# Altium project GTV11-Board.PrjPcb (part 1 of 4)
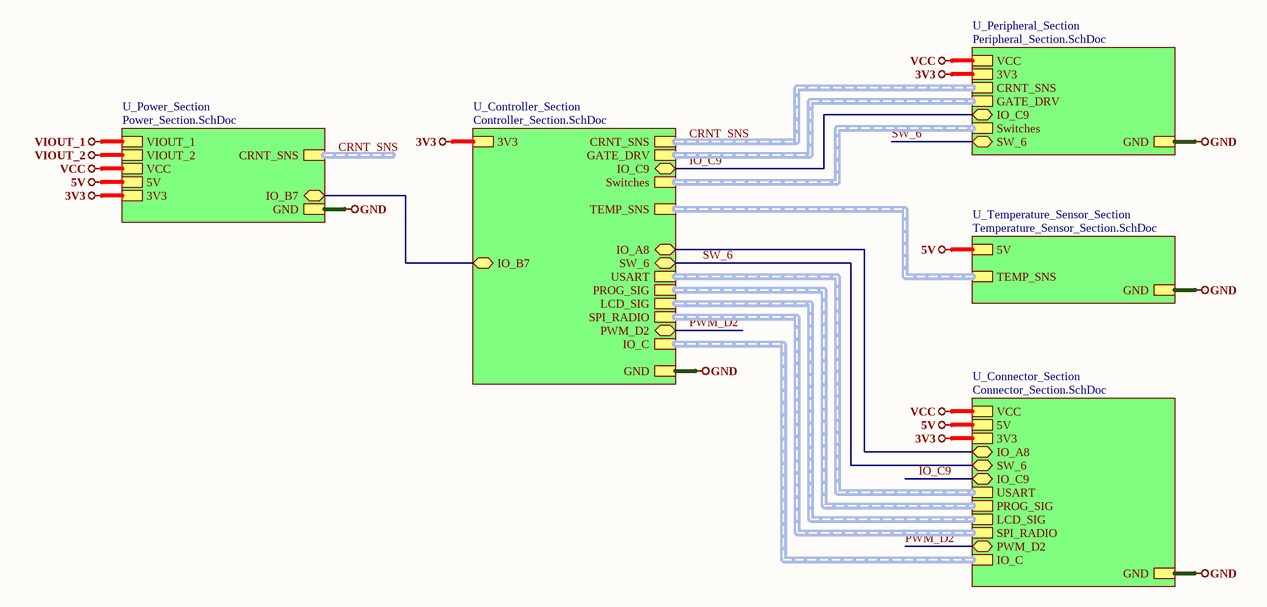
[diagram p0: Top_Sheet.SchDoc]
12 sheets, 168 parts. Net scope: hierarchical (ports join the sheet entries above them; power ports are global).
Sheets:
  Top_Sheet.SchDoc
    U_Power_Section = Power_Section.SchDoc
      U_Regulator_Sheet = Regulator_Sheet.SchDoc
      U_Current_Sense_Sheet = Current_Sense_Sheet.SchDoc
      U_Battery_Charger_Sheet = Battery_Charger_Sheet.SchDoc
    U_Controller_Section = Controller_Section.SchDoc
    U_Connector_Section = Connector_Section.SchDoc
    U_Peripheral_Section = Peripheral_Section.SchDoc
      U_Switches_Sheet = Switches_Sheet.SchDoc
      U_Gate_Driver_Sheet = Gate_Driver_Sheet.SchDoc
      U_Heater_Sheet = Heater_Sheet.SchDoc
    U_Temperature_Sensor_Section = Temperature_Sensor_Section.SchDoc

## Sheet Top_Sheet.SchDoc
size A4

### Sub-sheets
U_Connector_Section = Connector_Section.SchDoc: LCD_SIG (harness LCD_SIG), PROG_SIG (harness PROG_SIG), USART (harness DEBUG), IO_A8 (bidir), SW_6 (bidir), VCC, 5V, 3V3, GND, SPI_RADIO (harness SPI_RADIO), PWM_D2 (bidir), IO_C (harness SPI_RADIO), IO_C9 (bidir)
U_Controller_Section = Controller_Section.SchDoc: Switches (harness Switches), LCD_SIG (harness LCD_SIG), PROG_SIG (harness PROG_SIG), USART (harness DEBUG), IO_A8 (bidir), CRNT_SNS (harness CRNT_SNS), TEMP_SNS (harness TEMP_SNS), SW_6 (bidir), GATE_DRV (harness GATE_DRV), IO_C9 (bidir), GND, 3V3, IO_B7 (bidir), SPI_RADIO (harness SPI_RADIO), PWM_D2 (bidir), IO_C (harness SPI_RADIO)
U_Peripheral_Section = Peripheral_Section.SchDoc: VCC, GND, 3V3, GATE_DRV (harness GATE_DRV), IO_C9 (bidir), Switches (harness Switches), SW_6 (bidir), CRNT_SNS (harness CRNT_SNS)
U_Power_Section = Power_Section.SchDoc: VIOUT_1, VIOUT_2, VCC, 5V, 3V3, GND, CRNT_SNS (harness CRNT_SNS), IO_B7 (bidir)
U_Temperature_Sensor_Section = Temperature_Sensor_Section.SchDoc: TEMP_SNS (harness TEMP_SNS), 5V, GND

### Nets
3V3: sheet U_Power_Section/3V3, sheet U_Controller_Section/3V3, sheet U_Connector_Section/3V3, sheet U_Peripheral_Section/3V3
5V: sheet U_Power_Section/5V, sheet U_Connector_Section/5V, sheet U_Temperature_Sensor_Section/5V
GND: sheet U_Power_Section/GND, sheet U_Controller_Section/GND, sheet U_Connector_Section/GND, sheet U_Peripheral_Section/GND, sheet U_Temperature_Sensor_Section/GND
VCC: sheet U_Power_Section/VCC, sheet U_Connector_Section/VCC, sheet U_Peripheral_Section/VCC
IO_A8: sheet U_Controller_Section/IO_A8, sheet U_Connector_Section/IO_A8
IO_B7: sheet U_Power_Section/IO_B7, sheet U_Controller_Section/IO_B7
IO_C9: sheet U_Controller_Section/IO_C9, sheet U_Connector_Section/IO_C9, sheet U_Peripheral_Section/IO_C9
PWM_D2: sheet U_Controller_Section/PWM_D2, sheet U_Connector_Section/PWM_D2
SW_6: sheet U_Controller_Section/SW_6, sheet U_Connector_Section/SW_6, sheet U_Peripheral_Section/SW_6

### Buses and harness runs
harness CRNT_SNS = sheet U_Controller_Section/CRNT_SNS = sheet U_Peripheral_Section/CRNT_SNS
harness CRNT_SNS = sheet U_Power_Section/CRNT_SNS
harness sheet U_Connector_Section/IO_C = sheet U_Controller_Section/IO_C
harness sheet U_Connector_Section/LCD_SIG = sheet U_Controller_Section/LCD_SIG
harness sheet U_Connector_Section/PROG_SIG = sheet U_Controller_Section/PROG_SIG
harness sheet U_Connector_Section/SPI_RADIO = sheet U_Controller_Section/SPI_RADIO
harness sheet U_Connector_Section/USART = sheet U_Controller_Section/USART
harness sheet U_Controller_Section/GATE_DRV = sheet U_Peripheral_Section/GATE_DRV
harness sheet U_Controller_Section/Switches = sheet U_Peripheral_Section/Switches
harness sheet U_Controller_Section/TEMP_SNS = sheet U_Temperature_Sensor_Section/TEMP_SNS

## Sheet Power_Section.SchDoc
size A4
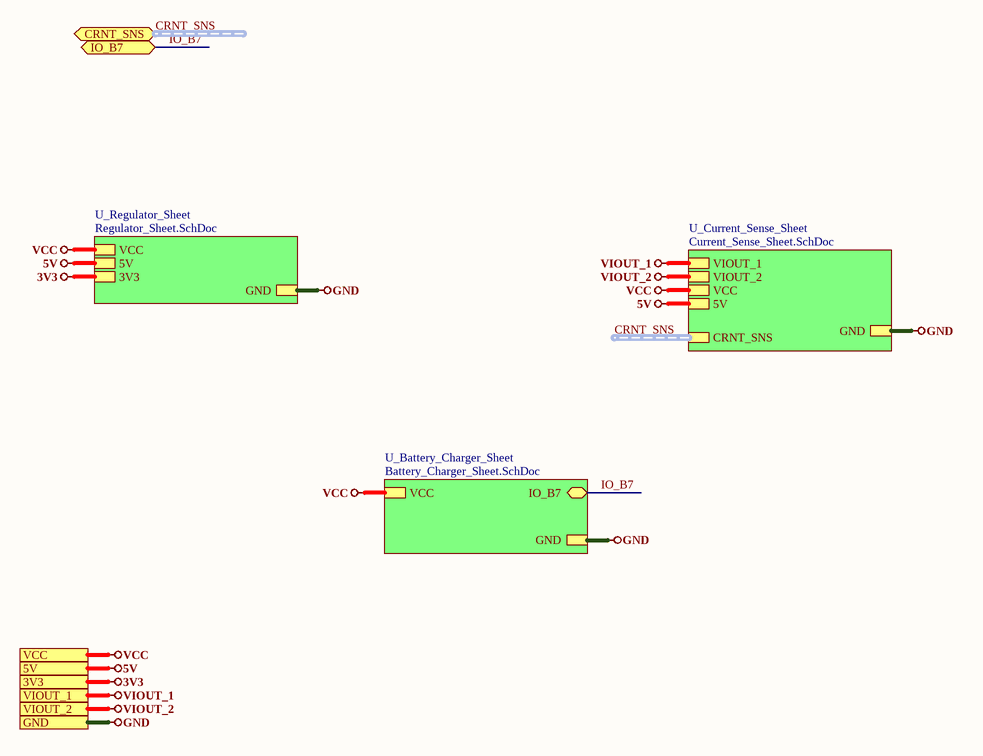
[diagram p1: Power_Section.SchDoc]

### Sub-sheets
U_Battery_Charger_Sheet = Battery_Charger_Sheet.SchDoc: VCC, GND, IO_B7 (bidir)
U_Current_Sense_Sheet = Current_Sense_Sheet.SchDoc: CRNT_SNS (harness CRNT_SNS), VIOUT_1, VCC, 5V, VIOUT_2, GND
U_Regulator_Sheet = Regulator_Sheet.SchDoc: VCC, 5V, 3V3, GND

### Ports
3V3, 5V, CRNT_SNS (bidir, harness CRNT_SNS), GND, IO_B7 (bidir), VCC, VIOUT_1, VIOUT_2

### Nets
3V3: port 3V3, sheet U_Regulator_Sheet/3V3
5V: port 5V, sheet U_Regulator_Sheet/5V, sheet U_Current_Sense_Sheet/5V
GND: port GND, sheet U_Regulator_Sheet/GND, sheet U_Current_Sense_Sheet/GND, sheet U_Battery_Charger_Sheet/GND
VCC: port VCC, sheet U_Regulator_Sheet/VCC, sheet U_Current_Sense_Sheet/VCC, sheet U_Battery_Charger_Sheet/VCC
VIOUT_1: port VIOUT_1, sheet U_Current_Sense_Sheet/VIOUT_1
VIOUT_2: port VIOUT_2, sheet U_Current_Sense_Sheet/VIOUT_2
IO_B7: port IO_B7, sheet U_Battery_Charger_Sheet/IO_B7

### Buses and harness runs
harness CRNT_SNS = port CRNT_SNS
harness CRNT_SNS = sheet U_Current_Sense_Sheet/CRNT_SNS

## Sheet Regulator_Sheet.SchDoc
size A4
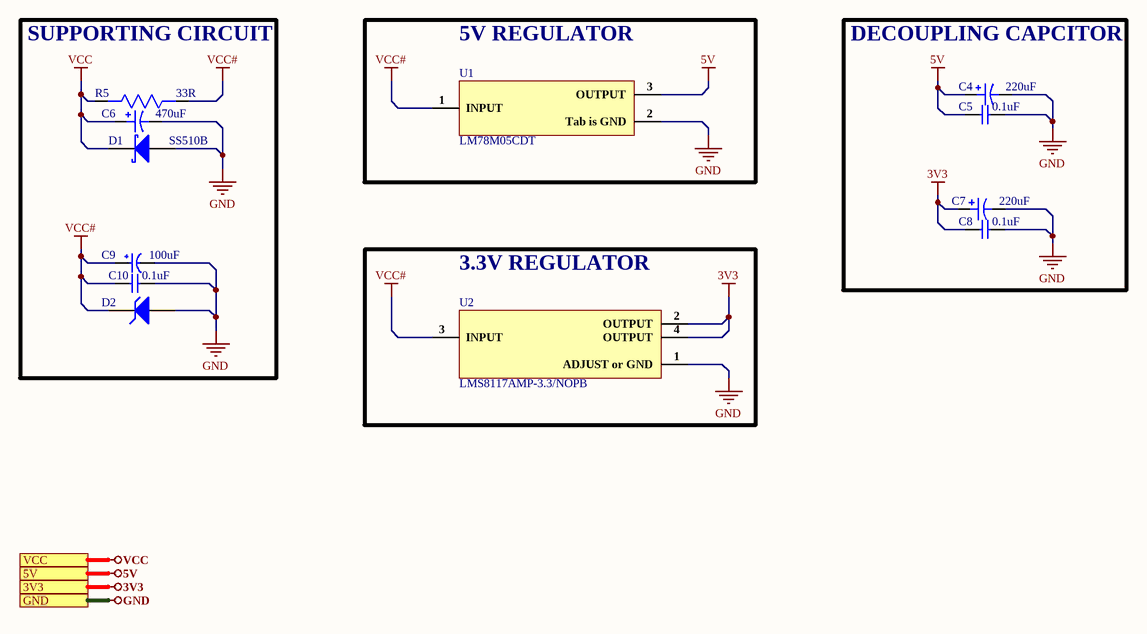
[diagram p2: Regulator_Sheet.SchDoc]

### Parts
C4  220uF  [UCD1H221MNL1GS]
C5  0.1uF  [Cap0603]
C6  470uF  [VT1H471MI135000CE0]
C7  220uF  [UCD1H221MNL1GS]
C8  0.1uF  [Cap0603]
C9  100uF  [UWX1E101MCL1GB]
C10  0.1uF  [Cap0603]
D1  SS510B  [SS510B]
D2  1SMA5930BT3G  [SMA]  (value not drawn)
R5  33R  [RES-0603]
U1  LM78M05CDT  [TO-252-3]
U2  LMS8117AMP-3.3/NOPB  [SOT-223]

### Blocks framed on the sheet
SUPPORTING CIRCUIT: C6 C9 C10 D1 D2 R5
5V REGULATOR: U1
DECOUPLING CAPCITOR: C4 C5 C7 C8
3.3V REGULATOR: U2

### Ports
3V3, 5V, GND, VCC

### Nets
3V3: C7.1 C8.1 U2.2(OUTPUT) U2.4(OUTPUT) ; port 3V3
5V: C4.1 C5.1 U1.3(OUTPUT) ; port 5V
GND: C4.2 C5.2 C6.2 C7.2 C8.2 C9.2 C10.2 D1.2(A) D2.2(A) U1.2(Tab_is_GND) U2.1(ADJUST_or_GND) ; port GND
VCC: C6.1 D1.1(K) R5.2 ; port VCC
VCC#: C9.1 C10.1 D2.1(K) R5.1 U1.1(INPUT) U2.3(INPUT)

### Library data of the parts
C4 C7 = UCD1H221MNL1GS: CAP ALUM 220UF 20% 50V SMD; Manufacturer: Nichicon; Ripple Current: 700mA; Impedance: 160mR; Leakage Current: 3uA; Life (Hours): 5000Hour; Dissipation Factor: 0.1%; Supplier 1: Digi-Key; Manufacturer Part Number: UCD1H221MNL1GS; RoHS: Yes; Category: Aluminum Electrolytic Capacitors; Pricing 1: 1=0.85000, 10=0.60200, 50=0.45480, 100=0.39620 (USD); Mount: Surface Mount,PCB; Case/Package: Radial; Min Operating Temperature: -55°C; Max Operating Temperature: 105°C; Capacitance: 220uF; Tolerance: 20%; Voltage Rating: 50V; Packaging: Tape and Reel; Package Quantity: 1; Voltage Rating (DC): 50V; Termination: SMD/SMT; Voltage: 50V; Features: General Purpose; Series: CD; Construction: Cylindrical; Diameter: 10mm; Length: 10mm; Height: 10mm; Height - Seated (Max): 0.394inch; Radiation Hardening: No; Lead Free: Lead Free; RoHS Compliant: Yes; ComponentLink1URL: https://datasheet.ciiva.com/11776/0900766b80ebdadd-11776792.pdf?src-supplier=RSComponents; ComponentLink1Description: https://datasheet.ciiva.com/11776/0900766b80ebdadd-11776792.pdf?src-supplier=RSComponents; ComponentLink2URL: https://datasheet.ciiva.com/5362/e-cd-22158-5362489.pdf?src-supplier=Mouser; ComponentLink2Description: https://datasheet.ciiva.com/5362/e-cd-22158-5362489.pdf?src-supplier=Mouser; ComponentLink3URL: https://datasheet.ciiva.com/11684/e-cd-11684678.pdf?src-supplier=Avnet; ComponentLink3Description: https://datasheet.ciiva.com/11684/e-cd-11684678.pdf?src-supplier=Avnet; ComponentLink4URL: https://datasheet.ciiva.com/15037/e-cd-15037119.pdf?src-supplier=Digi-Key; ComponentLink4Description: https://datasheet.ciiva.com/15037/e-cd-15037119.pdf?src-supplier=Digi-Key; ComponentLink5URL: https://datasheet.ciiva.com/16393/e-cd-16393493.pdf?src-supplier=Future+Electronics; ComponentLink5Description: https://datasheet.ciiva.com/16393/e-cd-16393493.pdf?src-supplier=Future+Electronics; ComponentLink6URL: https://datasheet.ciiva.com/17354/e-cd-17354606.pdf?src-supplier=Avnet+Europe; ComponentLink6Description: https://datasheet.ciiva.com/17354/e-cd-17354606.pdf?src-supplier=Avnet+Europe; Supplier Part Number 1: 493-6390-1-ND
C5 C8 C10 = CC0603ZRY5V9BB104: CAP CER 0.1UF 50V Y5V 0603; Manufacturer: Yageo; Capacitance: 100nF; Tolerance: 80%; Supplier 1: Digi-Key; Manufacturer Part Number: CC0603ZRY5V9BB104; Stock 1: 15000880; Pricing 1: 1=0.1, 10=0.075, 100=0.0334, 500=0.02386, 1000=0.01874 (USD); Mount: Surface Mount; Case/Package: 0603; Number of Pins: 2; Case Code (Metric): 1608; Case Code (Imperial): 0603; Min Operating Temperature: -30°C; Max Operating Temperature: 85°C; Dielectric: Y5V; Voltage Rating: 50V; Package Quantity: 1; Packaging: Tape and Reel; Voltage Rating (DC): 50V; Termination: SMD/SMT; Composition: Ceramic; Voltage: 50V; Length: 1.6mm; Height: 0.8mm; Width: 0.031inch; Thickness: 0.035inch; Depth: 0.8mm; Radiation Hardening: No; REACH SVHC: No SVHC; Lead Free: Lead Free; Halogen Free: Halogen Free; ComponentLink1URL: http://www.yageo.com/documents/recent/UPY-GPHC_Y5V_6.3V-to-50V_8.pdf?src-supplier=Digi-Key; ComponentLink1Description: http://www.yageo.com/documents/recent/UPY-GPHC_Y5V_6.3V-to-50V_8.pdf?src-supplier=Digi-Key; ComponentLink2URL: http://www.yageo.com/documents/recent/UPY-GPHC_Y5V_6.3V-to-50V_5.pdf?src-supplier=Avnet+Europe; ComponentLink2Description: http://www.yageo.com/documents/recent/UPY-GPHC_Y5V_6.3V-to-50V_5.pdf?src-supplier=Avnet+Europe; ComponentLink3URL: https://www.verical.com/server-webapp/html/getDatasheet?partID=403611&src-supplier=Verical; ComponentLink3Description: https://www.verical.com/server-webapp/html/getDatasheet?partID=403611&src-supplier=Verical; ComponentLink4URL: http://www.mouser.com/ds/2/447/Yageo_UPY-GP_NP0_16V-to-50V_9-358835.pdf?src-supplier=Mouser; ComponentLink4Description: http://www.mouser.com/ds/2/447/Yageo_UPY-GP_NP0_16V-to-50V_9-358835.pdf?src-supplier=Mouser; ComponentLink5URL: http://www.farnell.com/datasheets/1132289.pdf?src-supplier=Element14; ComponentLink5Description: http://www.farnell.com/datasheets/1132289.pdf?src-supplier=Element14; Supplier Part Number 1: 311-1343-1-ND
C6 = VT1H471MI135000CE0: 470uF ±20% 50V 12.5mm 13.5mm 1000hrs 105℃ -40℃~+105℃ SMD,12.5x13.5mm Aluminum Electrolytic Capacitors - SMD RoHS; Manufacturer: Changzhou Huawei Elec; Package: SMD,12.5x13.5mm; Capacitance: 470uF; Tolerance: ±20%; Rated Voltage: 50V; φD: 12.5mm; L: 13.5mm; Lifetime @ Temp: 1000hrs 105℃; Operating Temperature: -40℃~+105℃
C9 = UWX1E101MCL1GB: CAP ALUM 100UF 20% 25V SMD; Manufacturer: Nichicon; Dielectric Material: Aluminium; Ripple Current: 110mA; Polarity: Polar; Leakage Current: 3uA; Life (Hours): 2000Hour; Dissipation Factor: 0.14%; Lead Diameter: 0.8mm; Supplier 1: Digi-Key; Manufacturer Part Number: UWX1E101MCL1GB; Stock 1: 30613; Pricing 1: 1=0.43, 10=0.301, 50=0.211, 100=0.1808, 500=0.13558 (USD); Mount: Surface Mount; Case/Package: Radial; Number of Pins: 2; Weight: 0.01lb; Min Operating Temperature: -40°C; Max Operating Temperature: 85°C; Capacitance: 100uF; Tolerance: 20%; Ripple Current (AC): 110mA; Voltage Rating: 25V; Packaging: Tape and Reel; Package Quantity: 1000; Voltage Rating (DC): 25V; Termination: SMD/SMT; Voltage: 25V; Series: WX; Construction: Cylindrical; Diameter: 8mm; Length: 5.4mm; Width: 0.25inch; Height: 5.4mm; Lead Pitch: 2.3mm; Height - Seated (Max): 0.213inch; Radiation Hardening: No; REACH SVHC: No SVHC; Lead Free: Lead Free; RoHS Compliant: Yes; ComponentLink1URL: http://nichicon-us.com/english/products/pdfs/e-uwx.pdf?src-supplier=Digi-Key; ComponentLink1Description: http://nichicon-us.com/english/products/pdfs/e-uwx.pdf?src-supplier=Digi-Key; ComponentLink2URL: http://www.nichicon.co.jp/english/products/pdfs/e-ch_ref.pdf?src-supplier=Mouser; ComponentLink2Description: http://www.nichicon.co.jp/english/products/pdfs/e-ch_ref.pdf?src-supplier=Mouser; ComponentLink3URL: http://www.nichicon.co.jp/english/products/pdfs/e-wx.pdf?src-supplier=Avnet; ComponentLink3Description: http://www.nichicon.co.jp/english/products/pdfs/e-wx.pdf?src-supplier=Avnet; ComponentLink4URL: http://uk.rs-online.com/webdocs/0fa3/0900766b80fa3a90.pdf?src-supplier=RSComponents; ComponentLink4Description: http://uk.rs-online.com/webdocs/0fa3/0900766b80fa3a90.pdf?src-supplier=RSComponents; ComponentLink5URL: http://nichicon-us.com/english/products/pdfs/e-wx.pdf?src-supplier=Future+Electronics; ComponentLink5Description: http://nichicon-us.com/english/products/pdfs/e-wx.pdf?src-supplier=Future+Electronics; ComponentLink6URL: http://www.nichicon.co.jp/english/products/pdfs/e-ch_ref.pdf?src-supplier=Avnet+Europe; ComponentLink6Description: http://www.nichicon.co.jp/english/products/pdfs/e-ch_ref.pdf?src-supplier=Avnet+Europe; ComponentLink7URL: http://www.farnell.com/datasheets/2364658.pdf?src-supplier=Element14; ComponentLink7Description: http://www.farnell.com/datasheets/2364658.pdf?src-supplier=Element14; Supplier Part Number 1: 493-2113-6-ND; Supplier 2: Digi-Key; RoHS: Yes; Category: Aluminum Electrolytic Capacitors; Stock 2: 25010; Pricing 2: 1=0.43000, 10=0.30100, 50=0.21100, 100=0.18080, 500=0.13558 (USD); ComponentLink8URL: https://datasheet.ciiva.com/11778/0900766b80fa3a90-11778418.pdf?src-supplier=RSComponents; ComponentLink8Description: https://datasheet.ciiva.com/11778/0900766b80fa3a90-11778418.pdf?src-supplier=RSComponents; ComponentLink9URL: https://datasheet.ciiva.com/17527/e-wx-17527624.pdf?src-supplier=Avnet+Europe; ComponentLink9Description: https://datasheet.ciiva.com/17527/e-wx-17527624.pdf?src-supplier=Avnet+Europe; ComponentLink10URL: https://datasheet.ciiva.com/5361/e-wx-11809-5361100.pdf?src-supplier=Mouser; ComponentLink10Description: https://datasheet.ciiva.com/5361/e-wx-11809-5361100.pdf?src-supplier=Mouser; ComponentLink11URL: https://datasheet.ciiva.com/28458/1912851-28458684.pdf?src-supplier=Element14; ComponentLink11Description: https://datasheet.ciiva.com/28458/1912851-28458684.pdf?src-supplier=Element14; ComponentLink12URL: https://datasheet.ciiva.com/96/e-wx-96650.pdf?src-supplier=Digi-Key; ComponentLink12Description: https://datasheet.ciiva.com/96/e-wx-96650.pdf?src-supplier=Digi-Key; ComponentLink13URL: https://datasheet.ciiva.com/96/e-wx-96651.pdf?src-supplier=Digi-Key; ComponentLink13Description: https://datasheet.ciiva.com/96/e-wx-96651.pdf?src-supplier=Digi-Key; ComponentLink14URL: https://datasheet.ciiva.com/96/e-wx-96652.pdf?src-supplier=Digi-Key; ComponentLink14Description: https://datasheet.ciiva.com/96/e-wx-96652.pdf?src-supplier=Digi-Key; ComponentLink15URL: https://datasheet.ciiva.com/11687/e-wx-11687148.pdf?src-supplier=Avnet; ComponentLink15Description: https://datasheet.ciiva.com/11687/e-wx-11687148.pdf?src-supplier=Avnet; ComponentLink16URL: https://datasheet.ciiva.com/16512/e-wx-16512638.pdf?src-supplier=Future+Electronics; ComponentLink16Description: https://datasheet.ciiva.com/16512/e-wx-16512638.pdf?src-supplier=Future+Electronics; Supplier Part Number 2: 493-2113-1-ND
D1 = SS510B: SCHOTTKY DIODE SMB 100V 5A; Manufacturer: MDD; Manufacturer Part No: SS510B; Package: SMB
D2 = 1SMA5930BT3G: DIODE ZENER 16V 1.5W SMA; Manufacturer: ON Semiconductor; Tolerance: 5%; Max Reverse Leakage Current: 500nA; Impedance: 10R; Element Configuration: Single; Forward Voltage: 1.5V; Power Dissipation: 500mW; Zener Current: 94mA; Test Current: 23.4mA; ESD Protection: Yes; Supplier 1: Avnet; Manufacturer Part Number: 1SMA5930BT3G; RoHS: Yes; Category: Zener Diodes; Stock 1: 52; Pricing 1: 5000=0.16900 (USD); Case/Package: SMA; Number of Pins: 2; Contact Plating: Tin,Matte; Min Operating Temperature: -65°C; Max Operating Temperature: 150°C; Packaging: Tape and Reel; Package Quantity: 1; Max Power Dissipation: 1.5W; Voltage Tolerance: 5%; Zener Voltage: 16V; Working Voltage: 16V; Max Reverse Current: 500nA; Power Rating: 1.5W; Voltage Rating (DC): 16V; Length: 4.57mm; Width: 2.92mm; Height: 2.05mm; Radiation Hardening: No; Lead Free: Lead Free; Halogen Free: Halogen Free; RoHS Compliant: Yes; REACH SVHC: No SVHC; ComponentLink1URL: https://datasheet.ciiva.com/15142/getdatasheetpartid-39534-15142033.pdf?src-supplier=Verical; ComponentLink1Description: https://datasheet.ciiva.com/15142/getdatasheetpartid-39534-15142033.pdf?src-supplier=Verical; ComponentLink2URL: https://datasheet.ciiva.com/30478/0900766b8127698c-30478429.pdf?src-supplier=RSComponents; ComponentLink2Description: https://datasheet.ciiva.com/30478/0900766b8127698c-30478429.pdf?src-supplier=RSComponents; ComponentLink3URL: https://datasheet.ciiva.com/8026/1sma5913bt3-d-8026927.pdf?src-supplier=Element14; ComponentLink3Description: https://datasheet.ciiva.com/8026/1sma5913bt3-d-8026927.pdf?src-supplier=Element14; ComponentLink4URL: https://datasheet.ciiva.com/26092/1sma5913bt3-d-26092437.pdf?src-supplier=Avnet+Europe; ComponentLink4Description: https://datasheet.ciiva.com/26092/1sma5913bt3-d-26092437.pdf?src-supplier=Avnet+Europe; ComponentLink5URL: https://datasheet.ciiva.com/895/1sma5913bt3-d-895337.pdf?src-supplier=Digi-Key; ComponentLink5Description: https://datasheet.ciiva.com/895/1sma5913bt3-d-895337.pdf?src-supplier=Digi-Key; ComponentLink6URL: https://datasheet.ciiva.com/895/1sma5913bt3-d-895338.pdf?src-supplier=Digi-Key; ComponentLink6Description: https://datasheet.ciiva.com/895/1sma5913bt3-d-895338.pdf?src-supplier=Digi-Key; ComponentLink7URL: https://datasheet.ciiva.com/895/1sma5913bt3-d-895336.pdf?src-supplier=Digi-Key; ComponentLink7Description: https://datasheet.ciiva.com/895/1sma5913bt3-d-895336.pdf?src-supplier=Digi-Key; ComponentLink8URL: https://datasheet.ciiva.com/49028/70339291-49028059.pdf?src-supplier=Allied+Electronics; ComponentLink8Description: https://datasheet.ciiva.com/49028/70339291-49028059.pdf?src-supplier=Allied+Electronics; Supplier Part Number 1: 26K5257
R5 = RC0603FR-0733RL: RES SMD 0603 33 Ohm 1% 1/10W; Manufacturer: Yageo; Temperature Coefficient: 100ppm/°C; Voltage Rating (DC): 50V; Power Rating: 100mW; Voltage Rating: 75V; Supplier 1: Digi-Key; Manufacturer Part Number: RC0603FR-0733RL; RoHS: Yes; Category: Chip SMD Resistors; Stock 1: 41; Pricing 1: 1=0.10000, 10=0.02400, 100=0.00970, 1000=0.00436, 2500=0.00378 (USD); Case/Package: 0603; Number of Pins: 2; Case Code (Metric): 1608; Case Code (Imperial): 0603; Weight: 7.1E-05oz; Size Code: 0603; Min Operating Temperature: -55°C; Max Operating Temperature: 155°C; Resistance: 33R; Tolerance: 1%; Resistor Type: Thick Film; Packaging: Tape and Reel; Package Quantity: 1; Number of Terminations: 2; Termination: SMD/SMT; Max Power Dissipation: 100mW; Features: Moisture Resistant; Series: RC; Resistance Tolerance: 1%; Technology: THICK FILM; Construction: Rectangular; Length: 1.6mm; Width: 0.8mm; Height: 0.45mm; Depth: 0.8mm; Lead Pitch: 0.3mm; REACH SVHC: No SVHC; Lead Free: Lead Free; Military Standard: Not; RoHS Compliant: Yes; ComponentLink1URL: https://datasheet.ciiva.com/11808/0900766b80f96399-11808741.pdf?src-supplier=RSComponents; ComponentLink1Description: https://datasheet.ciiva.com/11808/0900766b80f96399-11808741.pdf?src-supplier=RSComponents; ComponentLink2URL: https://datasheet.ciiva.com/2453/pyu-r-int-thick-7-2453952.pdf?src-supplier=Digi-Key; ComponentLink2Description: https://datasheet.ciiva.com/2453/pyu-r-int-thick-7-2453952.pdf?src-supplier=Digi-Key; ComponentLink3URL: https://datasheet.ciiva.com/2453/pyu-r-int-thick-7-2453953.pdf?src-supplier=Digi-Key; ComponentLink3Description: https://datasheet.ciiva.com/2453/pyu-r-int-thick-7-2453953.pdf?src-supplier=Digi-Key; ComponentLink4URL: https://datasheet.ciiva.com/2453/pyu-r-int-thick-7-2453954.pdf?src-supplier=Digi-Key; ComponentLink4Description: https://datasheet.ciiva.com/2453/pyu-r-int-thick-7-2453954.pdf?src-supplier=Digi-Key; ComponentLink5URL: https://datasheet.ciiva.com/7660/38590-7660792.pdf?src-supplier=Element14; ComponentLink5Description: https://datasheet.ciiva.com/7660/38590-7660792.pdf?src-supplier=Element14; ComponentLink6URL: https://datasheet.ciiva.com/15189/getdatasheetpartid-326673-15189708.pdf?src-supplier=Verical; ComponentLink6Description: https://datasheet.ciiva.com/15189/getdatasheetpartid-326673-15189708.pdf?src-supplier=Verical; ComponentLink7URL: https://datasheet.ciiva.com/7746/443971-7746334.pdf?src-supplier=Element14; ComponentLink7Description: https://datasheet.ciiva.com/7746/443971-7746334.pdf?src-supplier=Element14; ComponentLink8URL: https://datasheet.ciiva.com/7746/443971-7746335.pdf?src-supplier=Element14; ComponentLink8Description: https://datasheet.ciiva.com/7746/443971-7746335.pdf?src-supplier=Element14; ComponentLink9URL: https://datasheet.ciiva.com/46395/443971-46395007.pdf?src-supplier=Element14; ComponentLink9Description: https://datasheet.ciiva.com/46395/443971-46395007.pdf?src-supplier=Element14; Supplier Part Number 1: 311-33.0HRCT-ND
U1 = LM78M05CDT: IC REG LINEAR 5V 500MA TO252-3; Manufacturer: TI National Semiconductor; Min Input Voltage: 7.2V; Number of Outputs: 1; Max Input Voltage: 35V; Polarity: Positive; Quiescent Current: 10mA; Output Type: Fixed; Power Supply Rejection Ratio (PSRR): 78dB; Dropout Voltage: 1.8V; Supplier 1: Digi-Key; Manufacturer Part Number: LM78M05CDT; RoHS: No; Category: Voltage Regulators - Linear; Stock 1: 815; Pricing 1: 1=2.68000, 10=2.40700, 25=2.27120, 100=1.93490, 250=1.81684, 500=1.58974, 1000=1.49975 (USD); Mount: Surface Mount; Case/Package: TO-252; Number of Pins: 3; Min Operating Temperature: -40°C; Max Operating Temperature: 125°C; Output Voltage: 5V; Packaging: Rail/Tube; Output Current: 500mA; Number of Regulators: 1; Series: -; Package Quantity: 75; Max Output Current: 500mA; Current Rating: 500mA; Length: 6.58mm; Width: 6.1mm; Height: 2.3mm; Radiation Hardening: No; Lead Free: Contains Lead; RoHS Compliant: No; ComponentLink1URL: https://datasheet.ciiva.com/26906/lm78m05cdt-26906263.pdf?src-supplier=IIIC; ComponentLink1Description: https://datasheet.ciiva.com/26906/lm78m05cdt-26906263.pdf?src-supplier=IIIC; ComponentLink2URL: https://datasheet.ciiva.com/6584/lm341-6584030.pdf?src-supplier=Digi-Key; ComponentLink2Description: https://datasheet.ciiva.com/6584/lm341-6584030.pdf?src-supplier=Digi-Key; Supplier Part Number 1: LM78M05CDT-ND
U2 = LMS8117AMP-3.3/NOPB: IC REG LINEAR 3.3V 1A SOT223; Manufacturer: Texas Instruments; Number of Outputs: 1; Min Input Voltage: 2.5V; Max Input Voltage: 15V; Polarity: Positive; Quiescent Current: 10mA; Accuracy: 1%; Output Type: Fixed; Dropout Voltage: 1.2V; Nominal Supply Current: 5mA; Supplier 1: Arrow Electronics; Manufacturer Part Number: LMS8117AMP-3.3/NOPB; RoHS: Yes; Category: Voltage Regulators - Linear; Stock 1: 843; Pricing 1: 1=1.18760, 10=1.01800, 100=0.77540, 250=0.68460, 500=0.64870, 1000=0.59270 (USD); Mount: Surface Mount; Case/Package: SOT-223; Number of Pins: 4; Contact Plating: Tin,Matte; Min Operating Temperature: 0°C; Max Operating Temperature: 125°C; Output Voltage: 3.3V; Max Output Current: 1A; Packaging: Tape and Reel; Output Current: 1A; Nominal Output Voltage: 3.3V; Output Voltage Accuracy: 1%; Current Rating: 1A; Package Quantity: 1000; Length: 6.5mm; Width: 3.56mm; Height: 1.6mm; Radiation Hardening: No; REACH SVHC: No SVHC; Lead Free: Lead Free; RoHS Compliant: Yes; ComponentLink1URL: https://datasheet.ciiva.com/3225/lms8117a-3225472.pdf?src-supplier=Avnet; ComponentLink1Description: https://datasheet.ciiva.com/3225/lms8117a-3225472.pdf?src-supplier=Avnet; ComponentLink2URL: https://datasheet.ciiva.com/2066/lms8117a-2066594.pdf?src-supplier=Digi-Key; ComponentLink2Description: https://datasheet.ciiva.com/2066/lms8117a-2066594.pdf?src-supplier=Digi-Key; ComponentLink3URL: https://datasheet.ciiva.com/2066/lms8117a-2066595.pdf?src-supplier=Digi-Key; ComponentLink3Description: https://datasheet.ciiva.com/2066/lms8117a-2066595.pdf?src-supplier=Digi-Key; ComponentLink4URL: https://datasheet.ciiva.com/2066/lms8117a-2066596.pdf?src-supplier=Digi-Key; ComponentLink4Description: https://datasheet.ciiva.com/2066/lms8117a-2066596.pdf?src-supplier=Digi-Key; ComponentLink5URL: https://datasheet.ciiva.com/3223/lms8117a-3223813.pdf?src-supplier=Avnet; ComponentLink5Description: https://datasheet.ciiva.com/3223/lms8117a-3223813.pdf?src-supplier=Avnet; ComponentLink6URL: https://datasheet.ciiva.com/25979/lms8117a-25979141.pdf?src-supplier=Avnet+Europe; ComponentLink6Description: https://datasheet.ciiva.com/25979/lms8117a-25979141.pdf?src-supplier=Avnet+Europe; ComponentLink7URL: https://datasheet.ciiva.com/46386/1558097-46386039.pdf?src-supplier=Element14; ComponentLink7Description: https://datasheet.ciiva.com/46386/1558097-46386039.pdf?src-supplier=Element14; ComponentLink8URL: https://datasheet.ciiva.com/8042/90386-8042363.pdf?src-supplier=Element14; ComponentLink8Description: https://datasheet.ciiva.com/8042/90386-8042363.pdf?src-supplier=Element14; ComponentLink9URL: https://datasheet.ciiva.com/5697/1558097-5697692.pdf?src-supplier=Farnell; ComponentLink9Description: https://datasheet.ciiva.com/5697/1558097-5697692.pdf?src-supplier=Farnell; Supplier Part Number 1: LMS8117AMP-3.3/NOPB

## Sheet Current_Sense_Sheet.SchDoc
size A4
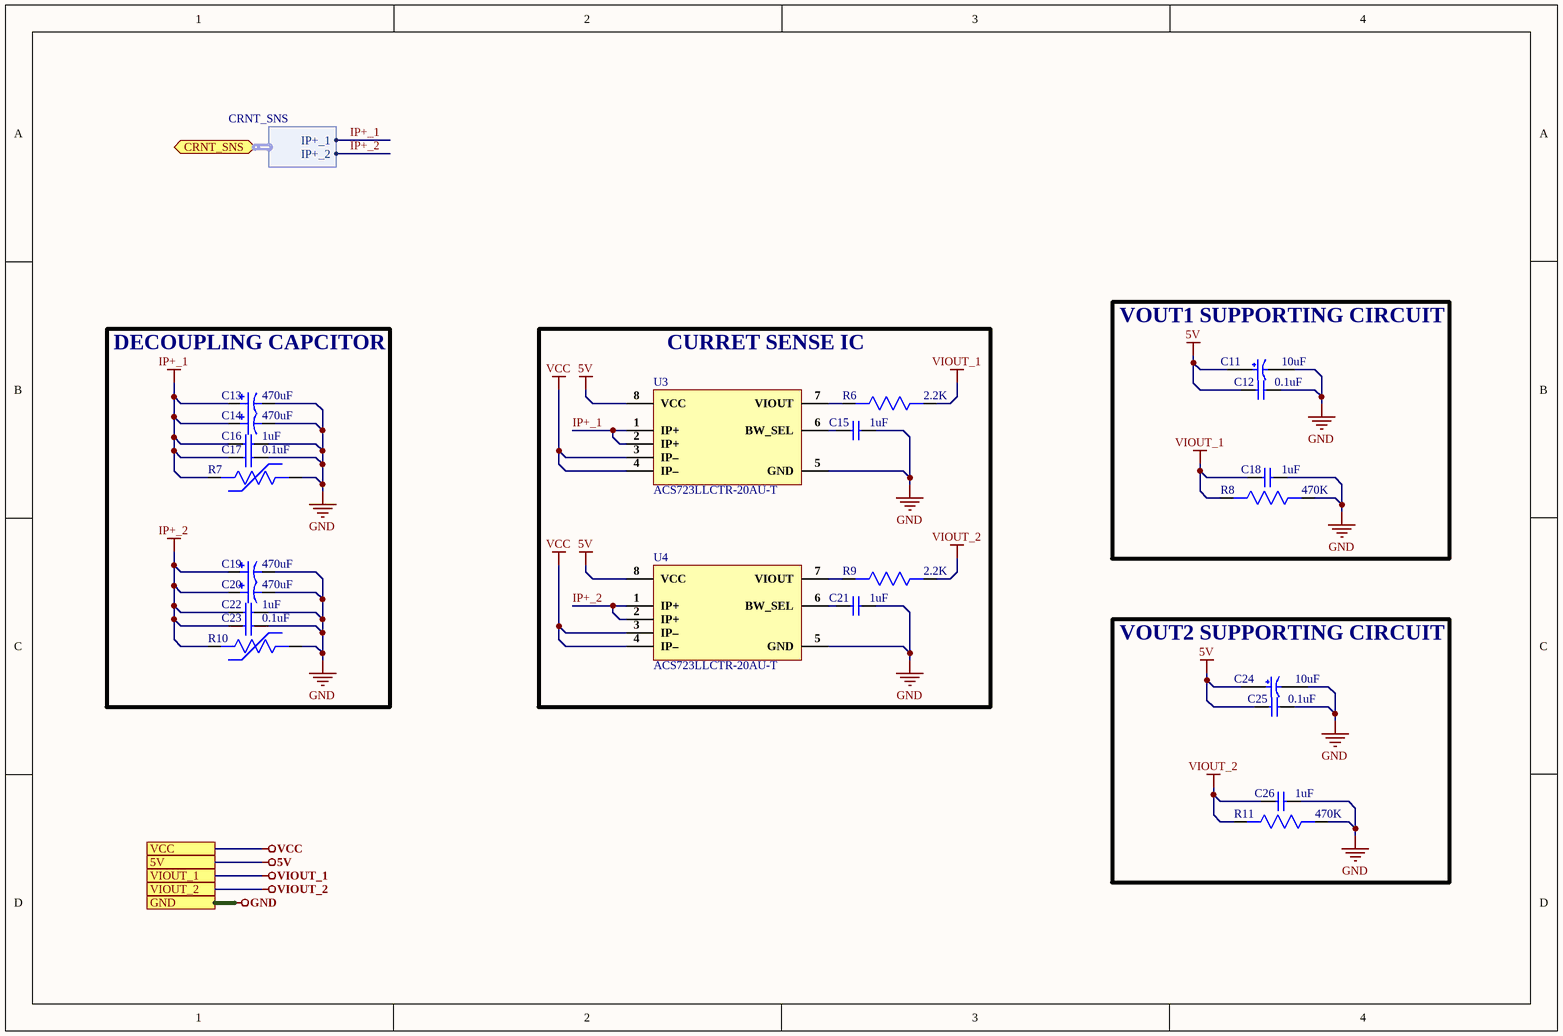
[diagram p3: Current_Sense_Sheet.SchDoc]

### Parts
C11  10uF  [RVT1E100M0405.]
C12  0.1uF  [Cap0603]
C13  470uF  [VT1H471MI135000CE0]
C14  470uF  [VT1H471MI135000CE0]
C15  1uF  [Cap0603]
C16  1uF  [Cap0603]
C17  0.1uF  [Cap0603]
C18  1uF  [Cap0603]
C19  470uF  [VT1H471MI135000CE0]
C20  470uF  [VT1H471MI135000CE0]
C21  1uF  [Cap0603]
C22  1uF  [Cap0603]
C23  0.1uF  [Cap0603]
C24  10uF  [RVT1E100M0405.]
C25  0.1uF  [Cap0603]
C26  1uF  [Cap0603]
R6  2.2K  [RES-0603]
R7  MOV-07D220K  [MOV-07D220K]  (value not drawn)
R8  470K  [RES-0603]
R9  2.2K  [RES-0603]
R10  MOV-07D220K  [MOV-07D220K]  (value not drawn)
R11  470K  [RES-0603]
U3  ACS723LLCTR-20AU-T  [SOIC-8]
U4  ACS723LLCTR-20AU-T  [SOIC-8]

### Blocks framed on the sheet
VOUT1 SUPPORTING CIRCUIT: C11 C12 C18 R8
DECOUPLING CAPCITOR: C13 C14 C16 C17 C19 C20 C22 C23 R7 R10
CURRET SENSE IC: C15 C21 R6 R9 U3 U4
VOUT2 SUPPORTING CIRCUIT: C24-C26 R11

### Ports
5V, CRNT_SNS (bidir, harness CRNT_SNS), GND, VCC, VIOUT_1, VIOUT_2

### Harnesses
CRNT_SNS: IP+_1, IP+_2

### Nets
5V: C11.1 C12.1 C24.1 C25.1 U3.8(VCC) U4.8(VCC) ; port 5V
GND: C11.2 C12.2 C13.2 C14.2 C15.2 C16.2 C17.2 C18.2 C19.2 C20.2 C21.2 C22.2 C23.2 C24.2 C25.2 C26.2 R7.1 R8.1 R10.1 R11.1 U3.5(GND) U4.5(GND) ; port GND
IP+_1: C13.1 C14.1 C16.1 C17.1 R7.2 U3.1(IP+) U3.2(IP+) ; port CRNT_SNS.IP+_1  [project net CRNT_SNS.IP+_1]
IP+_2: C19.1 C20.1 C22.1 C23.1 R10.2 U4.1(IP+) U4.2(IP+) ; port CRNT_SNS.IP+_2  [project net CRNT_SNS.IP+_2]
VCC: U3.3(IP–) U3.4(IP–) U4.3(IP–) U4.4(IP–) ; port VCC
VIOUT_1: C18.1 R6.1 R8.2 ; port VIOUT_1
VIOUT_2: C26.1 R9.1 R11.2 ; port VIOUT_2
NetC15_1: C15.1 U3.6(BW_SEL)
NetC21_1: C21.1 U4.6(BW_SEL)
NetR6_2: R6.2 U3.7(VIOUT)
NetR9_2: R9.2 U4.7(VIOUT)

### Library data of the parts
C11 C24 = RVT1E100M0405: CAP ALUM 10uF 25V SMD; Manufacturer: ROQANG; φD: 4mm; L: 5.4mm; Tolerance: ±20%; Operating Temperature: -45℃~+105℃; Rated Voltage: 25V; Capacitance: 10uF
C12 C17 C23 C25 = CC0603ZRY5V9BB104: as C5 on sheet Regulator_Sheet; Supplier 1: Digi-Key; Manufacturer Part Number: CC0603ZRY5V9BB104; Stock 1: 15000880; Pricing 1: 1=0.1, 10=0.075, 100=0.0334, 500=0.02386, 1000=0.01874 (USD); Mount: Surface Mount; Case/Package: 0603; Number of Pins: 2; Case Code (Metric): 1608; Case Code (Imperial): 0603; Min Operating Temperature: -30°C; Max Operating Temperature: 85°C; Dielectric: Y5V; Voltage Rating: 50V; Package Quantity: 1; Packaging: Tape and Reel; Voltage Rating (DC): 50V; Termination: SMD/SMT; Composition: Ceramic; Voltage: 50V; Length: 1.6mm; Height: 0.8mm; Width: 0.031inch; Thickness: 0.035inch; Depth: 0.8mm; Radiation Hardening: No; REACH SVHC: No SVHC; Lead Free: Lead Free; Halogen Free: Halogen Free; ComponentLink1URL: http://www.yageo.com/documents/recent/UPY-GPHC_Y5V_6.3V-to-50V_8.pdf?src-supplier=Digi-Key; ComponentLink1Description: http://www.yageo.com/documents/recent/UPY-GPHC_Y5V_6.3V-to-50V_8.pdf?src-supplier=Digi-Key; ComponentLink2URL: http://www.yageo.com/documents/recent/UPY-GPHC_Y5V_6.3V-to-50V_5.pdf?src-supplier=Avnet+Europe; ComponentLink2Description: http://www.yageo.com/documents/recent/UPY-GPHC_Y5V_6.3V-to-50V_5.pdf?src-supplier=Avnet+Europe; ComponentLink3URL: https://www.verical.com/server-webapp/html/getDatasheet?partID=403611&src-supplier=Verical; ComponentLink3Description: https://www.verical.com/server-webapp/html/getDatasheet?partID=403611&src-supplier=Verical; ComponentLink4URL: http://www.mouser.com/ds/2/447/Yageo_UPY-GP_NP0_16V-to-50V_9-358835.pdf?src-supplier=Mouser; ComponentLink4Description: http://www.mouser.com/ds/2/447/Yageo_UPY-GP_NP0_16V-to-50V_9-358835.pdf?src-supplier=Mouser; ComponentLink5URL: http://www.farnell.com/datasheets/1132289.pdf?src-supplier=Element14; ComponentLink5Description: http://www.farnell.com/datasheets/1132289.pdf?src-supplier=Element14; Supplier Part Number 1: 311-1343-1-ND
C13 C14 C19 C20 = VT1H471MI135000CE0: as C6 on sheet Regulator_Sheet; Package: SMD,12.5x13.5mm; Capacitance: 470uF; Tolerance: ±20%; Rated Voltage: 50V; φD: 12.5mm; L: 13.5mm; Lifetime @ Temp: 1000hrs 105℃; Operating Temperature: -40℃~+105℃
C15 C16 C18 C21 C22 C26 = CC0603KRX5R8BB105: CAP CER 1UF 25V X5R 0603; Manufacturer: Yageo; Tolerance: 10%; Supplier 1: Digi-Key; Manufacturer Part Number: CC0603KRX5R8BB105; Stock 1: 1419041; Pricing 1: 1=0.1, 10=0.069, 100=0.0307, 500=0.0219, 1000=0.0172 (USD); Mount: Surface Mount; Case/Package: 0603; Number of Pins: 2; Case Code (Metric): 1608; Case Code (Imperial): 0603; Min Operating Temperature: -55°C; Max Operating Temperature: 85°C; Capacitance: 1uF; Dielectric: X5R; Package Quantity: 1; Voltage Rating: 25V; Packaging: Tape and Reel; Termination: SMD/SMT; Voltage Rating (DC): 25V; Length: 1.6mm; Height: 0.8mm; Width: 0.031inch; Thickness: 0.035inch; Depth: 0.8mm; Radiation Hardening: No; REACH SVHC: No SVHC; Lead Free: Lead Free; Halogen Free: Halogen Free; ComponentLink1URL: http://www.yageo.com/documents/recent/UPY-GPHC_X5R_4V-to-50V_25.pdf?src-supplier=Digi-Key; ComponentLink1Description: http://www.yageo.com/documents/recent/UPY-GPHC_X5R_4V-to-50V_25.pdf?src-supplier=Digi-Key; ComponentLink2URL: http://www.yageo.com/documents/recent/UPY-GPHC_X5R_4V-to-50V_12.pdf?src-supplier=Avnet+Europe; ComponentLink2Description: http://www.yageo.com/documents/recent/UPY-GPHC_X5R_4V-to-50V_12.pdf?src-supplier=Avnet+Europe; ComponentLink3URL: http://www.farnell.com/datasheets/1525783.pdf?src-supplier=Element14; ComponentLink3Description: http://www.farnell.com/datasheets/1525783.pdf?src-supplier=Element14; ComponentLink4URL: http://www.yageo.com/documents/recent/UPY-GPHC_X5R_4V-to-50V_12.pdf?src-supplier=Avnet; ComponentLink4Description: http://www.yageo.com/documents/recent/UPY-GPHC_X5R_4V-to-50V_12.pdf?src-supplier=Avnet; Supplier Part Number 1: 311-1445-6-ND
R6 R9 = RC0603FR-072K2L: RES SMD 2.2K OHM 1% 1/10W 0603; Manufacturer: Yageo Phycomp; Temperature Coefficient: 100ppm/°C; Resistance: 2.2kR; Power Rating: 100mW; Voltage Rating (DC): 50V; Supplier 1: Digi-Key; Manufacturer Part Number: RC0603FR-072K2L; Stock 1: 10587920; Pricing 1: 1=0.1, 10=0.023, 100=0.0094, 1000=0.00421, 2500=0.00366 (USD); Mount: Surface Mount; Case/Package: 0603; Number of Pins: 2; Min Operating Temperature: -55°C; Max Operating Temperature: 155°C; Tolerance: 1%; Packaging: Cut Tape; Length: 1.6mm; Height: 0.45mm; Width: 800um; Depth: 0.8mm; REACH SVHC: No SVHC; Lead Free: Lead Free; Supplier Part Number 1: 311-2.20KHRCT-ND
R7 R10 = MOV-07D220K: VARISTOR 22V 250A DISC 7MM; Manufacturer: Bourns; Capacitance: 2.3nF; Voltage Rating (DC): 24V; Tolerance: 10%; Max Voltage Rating (AC): 14V; Max Voltage Rating (DC): 18V; Number of Circuits: 1; Energy: 1.1J; Clamping Voltage: 43V; Clamping Current: 2.5A; Min Varistor Voltage: 20V; Lead/Base Style: Radial; Supplier 1: Digi-Key; Manufacturer Part Number: MOV-07D220K; RoHS: Yes; Category: Varistors; Stock 1: 292; Pricing 1: 1=0.43000, 10=0.30800, 25=0.23920, 100=0.18130, 250=0.12824, 500=0.10260, 1000=0.07866, 2500=0.06840, 5000=0.06156 (USD); Mount: Through Hole,Radial; Case/Package: Radial; Min Operating Temperature: -40°C; Max Operating Temperature: 85°C; Packaging: Bulk; Max Surge Current: 250A; Package Quantity: 2000; Varistor Voltage: 22V; Max Varistor Voltage: 24V; Series: -; Diameter: 7mm; Width: 6.8mm; Lead Pitch: 5mm; Radiation Hardening: No; RoHS Compliant: Yes; ComponentLink1URL: https://datasheet.ciiva.com/30093/mov07d-30093751.pdf?src-supplier=Onlinecomponents.com; ComponentLink1Description: https://datasheet.ciiva.com/30093/mov07d-30093751.pdf?src-supplier=Onlinecomponents.com; ComponentLink2URL: https://datasheet.ciiva.com/369/mov07d-369225.pdf?src-supplier=Digi-Key; ComponentLink2Description: https://datasheet.ciiva.com/369/mov07d-369225.pdf?src-supplier=Digi-Key; ComponentLink3URL: https://datasheet.ciiva.com/3026/mov07d-3026223.pdf?src-supplier=Avnet; ComponentLink3Description: https://datasheet.ciiva.com/3026/mov07d-3026223.pdf?src-supplier=Avnet; Supplier Part Number 1: MOV-07D220K-ND
R8 R11 = AC0603JR-07470KL: RES SMD 470K OHM 5% 1/10W 0603; Manufacturer: Yageo; Resistance: 470kR; Power Rating: 100mW; Voltage Rating: 50V; Temperature Coefficient: 100ppm/°C; ComponentLink1URL: https://datasheet.ciiva.com/11820/0900766b80808d64-11820639.pdf?src-supplier=RSComponents; ComponentLink1Description: https://datasheet.ciiva.com/11820/0900766b80808d64-11820639.pdf?src-supplier=RSComponents; ComponentLink2URL: https://datasheet.ciiva.com/2487/rr-data-sheet-2487286.pdf?src-supplier=Digi-Key; ComponentLink2Description: https://datasheet.ciiva.com/2487/rr-data-sheet-2487286.pdf?src-supplier=Digi-Key; ComponentLink3URL: https://datasheet.ciiva.com/7984/87330-7984374.pdf?src-supplier=Element14; ComponentLink3Description: https://datasheet.ciiva.com/7984/87330-7984374.pdf?src-supplier=Element14; ComponentLink4URL: https://datasheet.ciiva.com/2487/rr-data-sheet-2487287.pdf?src-supplier=Digi-Key; ComponentLink4Description: https://datasheet.ciiva.com/2487/rr-data-sheet-2487287.pdf?src-supplier=Digi-Key; ComponentLink5URL: https://datasheet.ciiva.com/2487/rr-data-sheet-2487288.pdf?src-supplier=Digi-Key; ComponentLink5Description: https://datasheet.ciiva.com/2487/rr-data-sheet-2487288.pdf?src-supplier=Digi-Key; ComponentLink6URL: https://datasheet.ciiva.com/5759/87330-5759049.pdf?src-supplier=Farnell; ComponentLink6Description: https://datasheet.ciiva.com/5759/87330-5759049.pdf?src-supplier=Farnell; Supplier 1: Digi-Key; Manufacturer Part Number: AC0603JR-07470KL; Stock 1: 71; Pricing 1: 1=0.1, 10=0.024, 100=0.0097, 1000=0.0044, 2500=0.0038 (USD); Case/Package: 0603; Case Code (Imperial): 0603; Case Code (Metric): 1608; Weight: 7.1E-05oz; Min Operating Temperature: -55°C; Max Operating Temperature: 155°C; Tolerance: 5%; Packaging: Tape and Reel; Resistor Type: Thick Film; Termination: SMD/SMT; Number of Terminations: 2; Max Power Dissipation: 100mW; Features: Moisture Resistant,Automotive AEC-Q200; Series: AC; Length: 0.063inch; Width: 0.8mm; Height: 0.022inch; RoHS Compliant: Yes; ComponentLink7URL: http://www.mouser.com/ds/2/447/yageodocoutput-1111992.pdf?src-supplier=Mouser; ComponentLink7Description: http://www.mouser.com/ds/2/447/yageodocoutput-1111992.pdf?src-supplier=Mouser; Supplier Part Number 1: YAG3672DKR-ND
U3 U4 = ACS723LLCTR-20AU-T: SENSOR CURRENT HALL 20A DC; Manufacturer: Allegro MicroSystems; Number of Channels: 1; Frequency: 80kHz; Response Time: 5us; Max Supply Current: 14mA; Polarity: Unidirectional; Linearity: 1%; Accuracy: 3%; Sensitivity: 200mV/A; Supplier 1: Digi-Key; Manufacturer Part Number: ACS723LLCTR-20AU-T; RoHS: Yes; Category: Current Sensors; Pricing 1: 1=4.46000, 5=3.94000, 10=3.47900, 25=2.82280, 50=2.49480, 100=2.42900, 500=2.03516, 1000=1.90385 (USD); Mount: Surface Mount; Case/Package: SOIC; Number of Pins: 8; Min Operating Temperature: -40°C; Max Operating Temperature: 150°C; Packaging: Tape and Reel; Current Sensing: 20A; RoHS Compliant: Yes; ComponentLink1URL: http://www.farnell.com/datasheets/2838158.pdf?src-supplier=Farnell; ComponentLink1Description: http://www.farnell.com/datasheets/2838158.pdf?src-supplier=Farnell; ComponentLink2URL: http://www.farnell.com/datasheets/2838158.pdf?src-supplier=Newark; ComponentLink2Description: http://www.farnell.com/datasheets/2838158.pdf?src-supplier=Newark; ComponentLink3URL: http://www.allegromicro.com/~/media/Files/Datasheets/ACS723-Datasheet.ashx?src-supplier=Digi-Key; ComponentLink3Description: http://www.allegromicro.com/~/media/Files/Datasheets/ACS723-Datasheet.ashx?src-supplier=Digi-Key; ComponentLink4URL: https://www.allegromicro.com/~/media/Files/Datasheets/ACS723-Datasheet.ashx?src-supplier=Digi-Key; ComponentLink4Description: https://www.allegromicro.com/~/media/Files/Datasheets/ACS723-Datasheet.ashx?src-supplier=Digi-Key; Supplier Part Number 1: 620-1645-1-ND